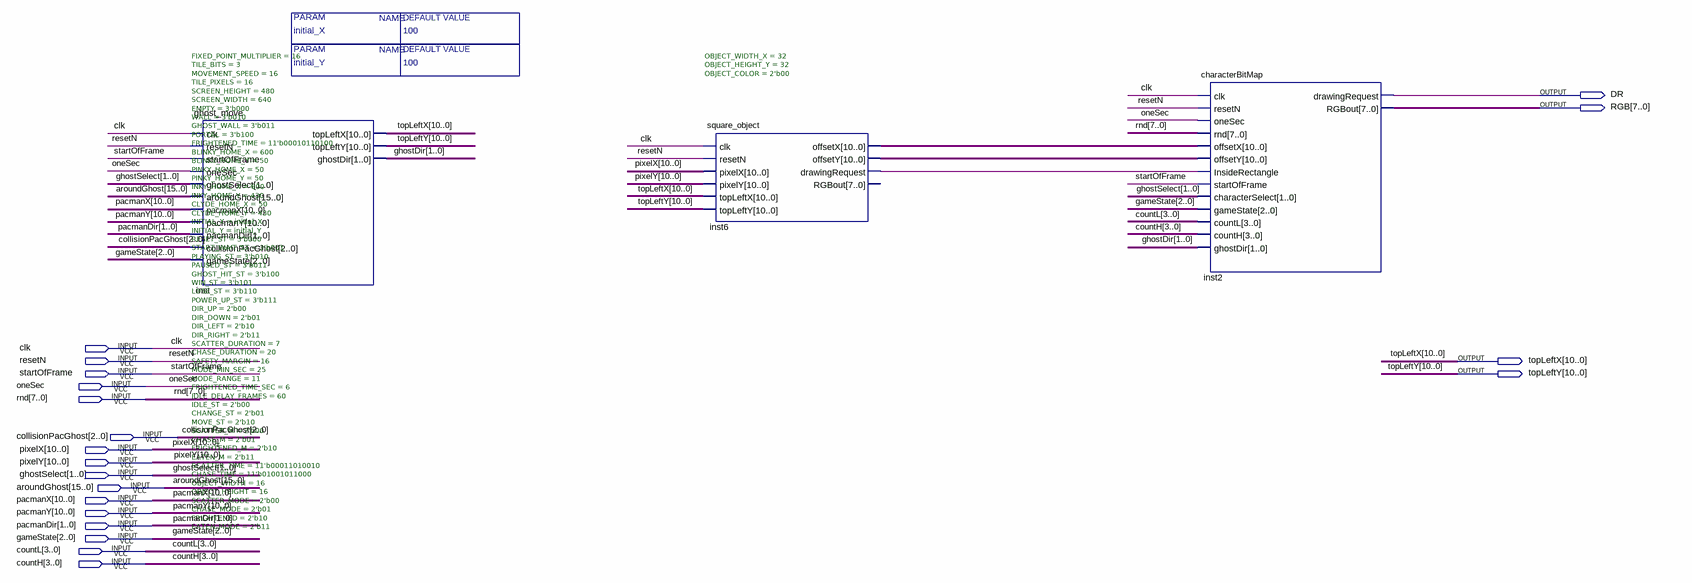
[diagram p0: schematic sheet]
// Quartus schematic Ghost.bdf as structural Verilog: 3 symbols, 20 pins
module Ghost #(parameter initial_X = 100, parameter initial_Y = 100) (
  input  clk,
  input  resetN,
  input  startOfFrame,
  input  oneSec,
  input  [7:0] rnd,
  input  [2:0] collisionPacGhost,
  input  [10:0] pixelX,
  input  [10:0] pixelY,
  input  [1:0] ghostSelect,
  input  [15:0] aroundGhost,
  input  [10:0] pacmanX,
  input  [10:0] pacmanY,
  input  [1:0] pacmanDir,
  input  [2:0] gameState,
  input  [3:0] countL,
  input  [3:0] countH,
  output DR,
  output [7:0] RGB,
  output [10:0] topLeftX,
  output [10:0] topLeftY
);

  wire inst6_drawingrequest;
  wire [1:0] ghostDir;
  wire [10:0] inst6_offsetx, inst6_offsety;

  ghost_move #(.FIXED_POINT_MULTIPLIER(16), .TILE_BITS(3), .MOVEMENT_SPEED(16), .TILE_PIXELS(16), .SCREEN_HEIGHT(480), .SCREEN_WIDTH(640), .EMPTY(3'b000), .WALL(3'b010), .GHOST_WALL(3'b011), .PORTAL(3'b100), .FRIGHTENED_TIME(11'b00010110100), .BLINKY_HOME_X(600), .BLINKY_HOME_Y(50), .PINKY_HOME_X(50), .PINKY_HOME_Y(50), .INKY_HOME_X(600), .INKY_HOME_Y(430), .CLYDE_HOME_X(50), .CLYDE_HOME_Y(430), .INITIAL_X(initial_X), .INITIAL_Y(initial_Y), .RESET_ST(3'b000), .START_WAIT_ST(3'b001), .PLAYING_ST(3'b010), .PAUSED_ST(3'b011), .GHOST_HIT_ST(3'b100), .WIN_ST(3'b101), .LOSE_ST(3'b110), .POWER_UP_ST(3'b111), .DIR_UP(2'b00), .DIR_DOWN(2'b01), .DIR_LEFT(2'b10), .DIR_RIGHT(2'b11), .SCATTER_DURATION(7), .CHASE_DURATION(20), .SAFETY_MARGIN(16), .MODE_MIN_SEC(25), .MODE_RANGE(11), .FRIGHTENED_TIME_SEC(6), .IDLE_DELAY_FRAMES(60), .IDLE_ST(2'b00), .CHANGE_ST(2'b01), .MOVE_ST(2'b10), .SCATTER_M(2'b00), .CHASE_M(2'b01), .FRIGHTENED_M(2'b10), .EATEN_M(2'b11), .SCATTER_TIME(11'b00011010010), .CHASE_TIME(11'b01001011000), .OBJECT_WIDTH(16), .OBJECT_HEIGHT(16), .SCATTER_MODE(2'b00), .CHASE_MODE(2'b01), .FRIGHTENED(2'b10), .EATEN_MODE(2'b11)) inst (
    .clk(clk), .resetN(resetN), .startOfFrame(startOfFrame), .oneSec(oneSec), .ghostSelect(ghostSelect),
    .aroundGhost(aroundGhost), .pacmanX(pacmanX), .pacmanY(pacmanY), .pacmanDir(pacmanDir),
    .collisionPacGhost(collisionPacGhost), .gameState(gameState), .topLeftX(topLeftX), .topLeftY(topLeftY),
    .ghostDir(ghostDir));
  square_object #(.OBJECT_WIDTH_X(32), .OBJECT_HEIGHT_Y(32), .OBJECT_COLOR(2'b00)) inst6 (
    .clk(clk), .resetN(resetN), .pixelX(pixelX), .pixelY(pixelY), .topLeftX(topLeftX), .topLeftY(topLeftY),
    .offsetX(inst6_offsetx), .offsetY(inst6_offsety), .drawingRequest(inst6_drawingrequest));  // open: RGBout
  characterBitMap inst2 (
    .clk(clk), .resetN(resetN), .oneSec(oneSec), .rnd(rnd), .offsetX(inst6_offsetx), .offsetY(inst6_offsety),
    .InsideRectangle(inst6_drawingrequest), .startOfFrame(startOfFrame), .characterSelect(ghostSelect),
    .gameState(gameState), .countL(countL), .countH(countH), .ghostDir(ghostDir), .drawingRequest(DR),
    .RGBout(RGB));
endmodule
